# EAGLE schematic BenchTop_PHMETER_V_1.1.2 (EAGLE 9.6.2)
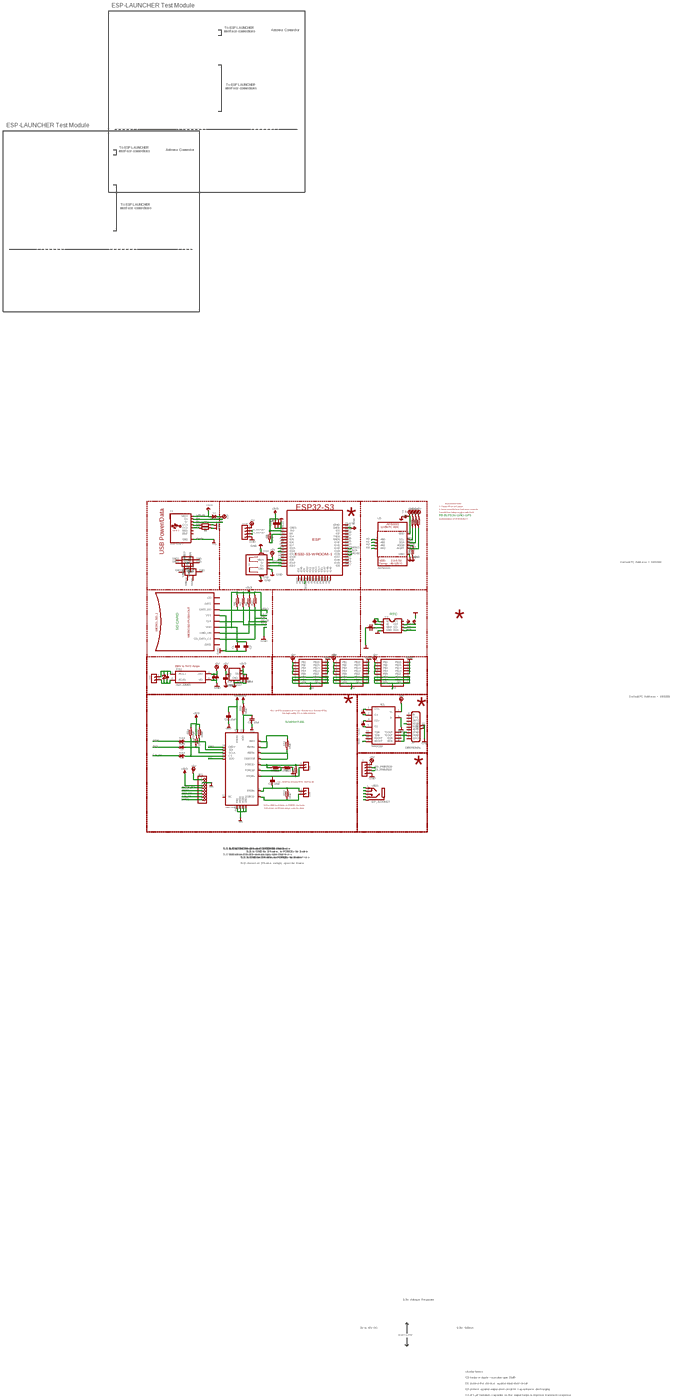
[diagram p0: schematic, sheet 1, overview]
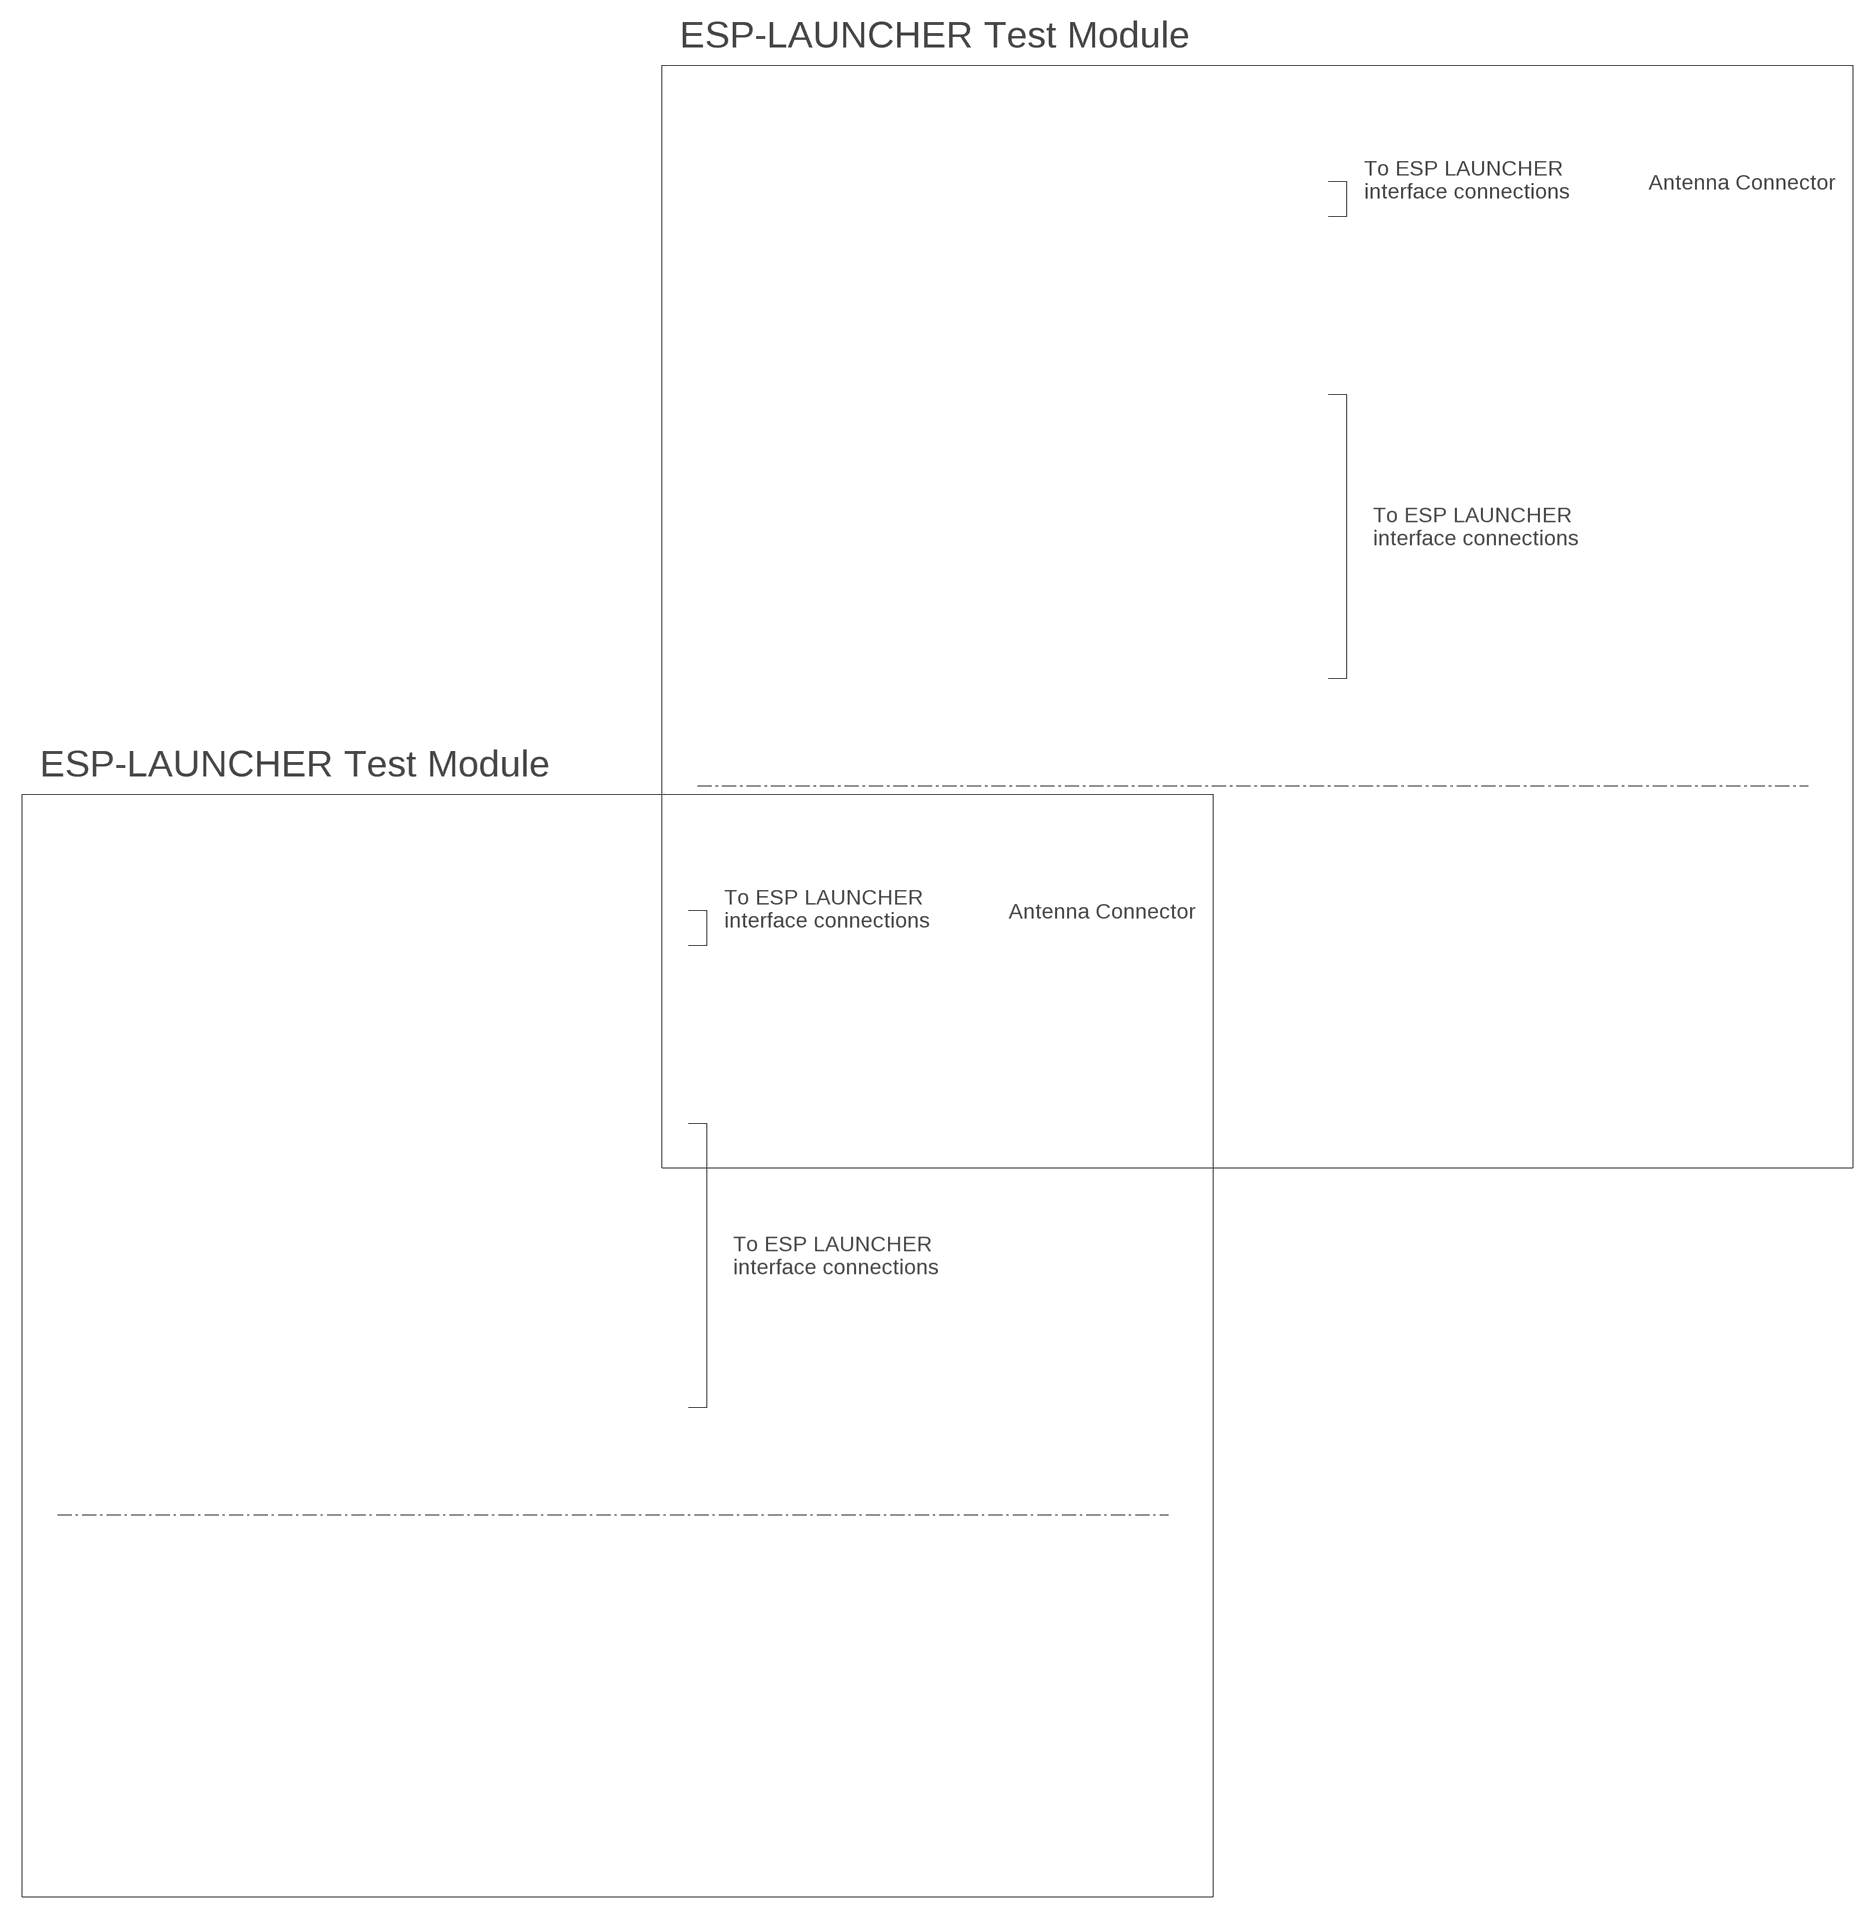
[diagram p1: schematic, sheet 1, part 1 of 4]
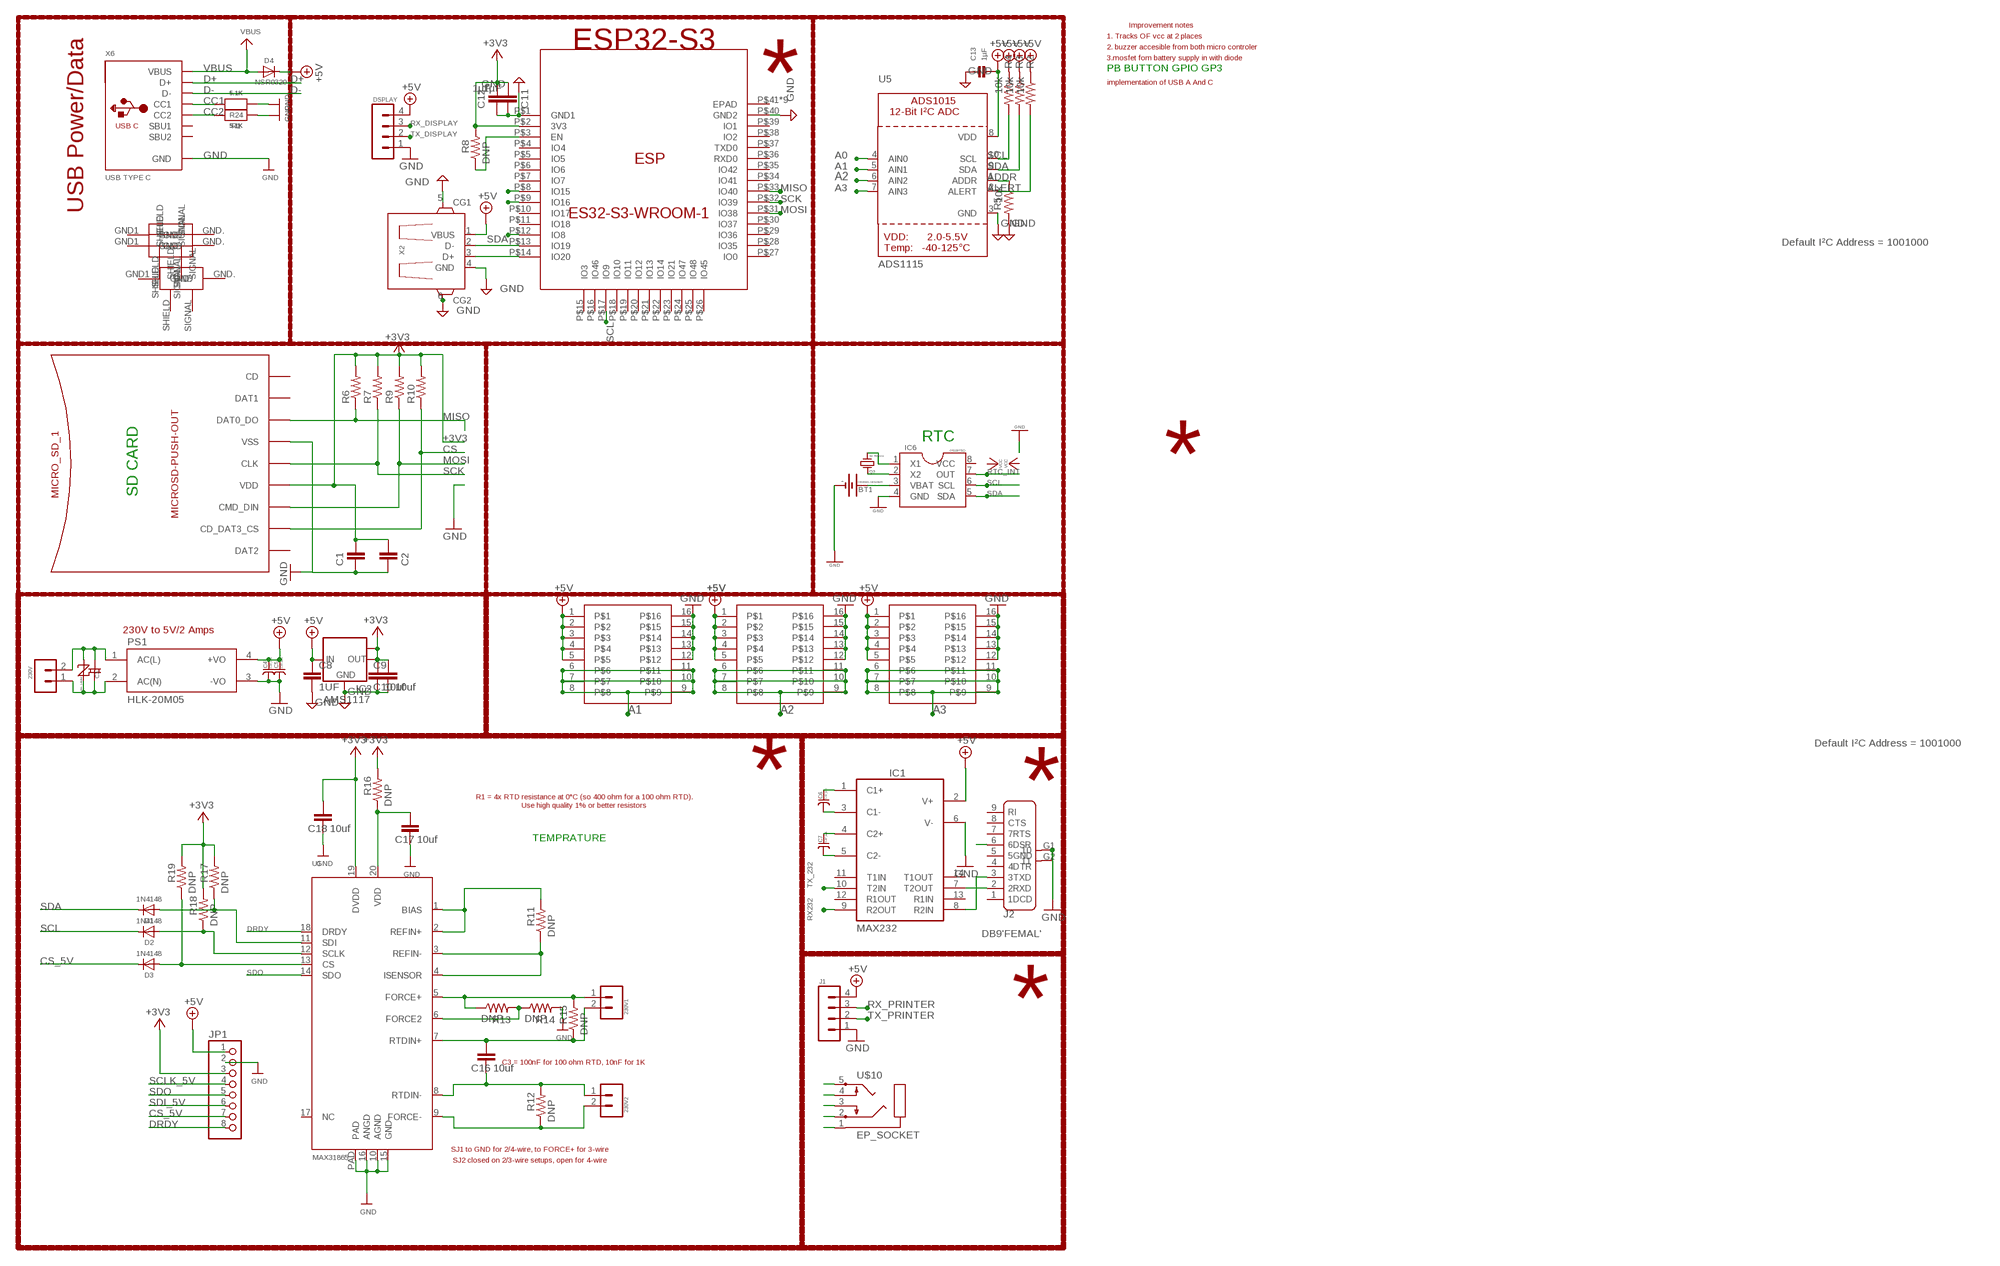
[diagram p2: schematic, sheet 1, part 2 of 4]
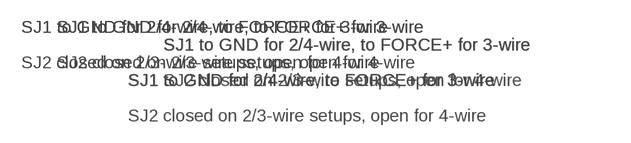
[diagram p3: schematic, sheet 1, part 3 of 4]
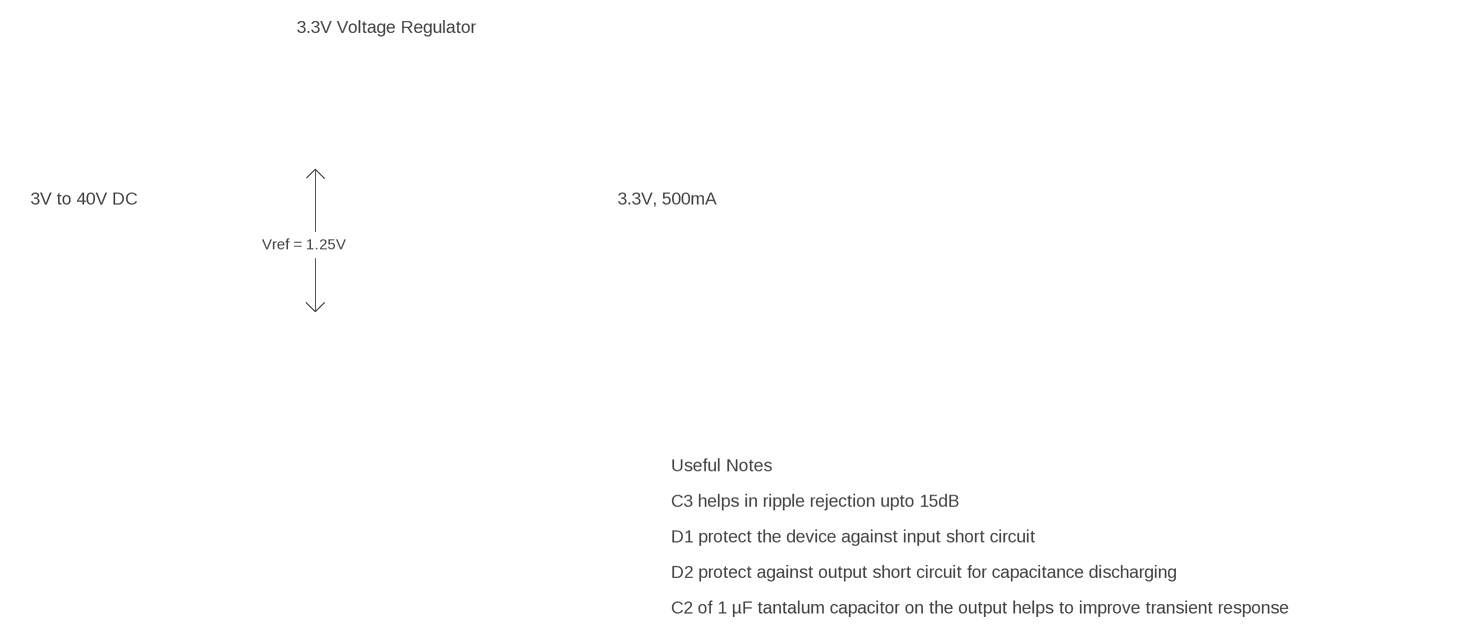
[diagram p4: schematic, sheet 1, part 4 of 4]

## Parts
230V  JST_2-PIN_1.27MMXY-126  [2-PIN_PBT_5.0MM_XY126]
230V1  JST_2-PIN_1.27MMXY-126  [2-PIN_PBT_5.0MM_XY126]
230V2  JST_2-PIN_1.27MMXY-126  [2-PIN_PBT_5.0MM_XY126]
BT1  CR2032+ HOLDER  CELL  [CELL_2032]
C1  C-EUC1206  [C1206]
C2  C-EUC1206  [C1206]
C3  CAP_X2-R  [LD22]
C4  CAP_ELE  [C_8MM]
C5  CAP_ELE  [C_8MM]
C6  CAP_ELE  [C_8MM]
C7  CAP_ELE  [C_8MM]
C8  1UF  C-EUC1206K  [C1206K]
C9  10uf  C-EUC1206K  [C1206K]
C10  10uf  C-EUC1206K  [C1206K]
C11  1µF  C-EUC0805K  [C0805K]
C12  1µF  C-EUC0805K  [C0805K]
C13  1µF  CAP_CERAMIC0805  [0805]
C16  10uf  C-EUC1206K  [C1206K]
C17  10uf  C-EUC1206K  [C1206K]
C18  10uf  C-EUC1206K  [C1206K]
D1  1N4148  DIODESOD-323  [SOD-323]
D2  1N4148  DIODESOD-323  [SOD-323]
D3  1N4148  DIODESOD-323  [SOD-323]
D4  NSR0320  DIODE_SOD323MINI  [SOD-323_MINI]
DSPLAY  JST_4-PINM  [MOLEX_4-PIN]
ESP  ES32-S3-WROOM-1  [ESP32-S3-WROOM-1]
IC1  MAX232  [DIL16]
IC2  AMS1117  LM1117MPX-5.0  [SOT223]
IC6  DS1307SO  [SOIC-08]
J1  JST_4-PINM  [MOLEX_4-PIN]
J2  DB9'FEMAL'  [DB9]
JP1  HEADER-1X870MIL  [1X08_ROUND_70]
MICRO_SD_1  MICROSD-PUSH-OUT  [MICROSD-PUSH-OUT]
PS1  HLK-20M05  [CONV_HLK-20M05]
Q3  32.768KHz  CRYSTALTC26H  [TC26H]
R1  5.1K  RESISTOR_0402NO  [_0402NO]
R2  10k  R-US_R0603  [R0603]
R3  10k  R-US_R0603  [R0603]
R4  10k  R-US_R0603  [R0603]
R5  10k  R-US_R0603  [R0603]
R6  R-US_M1206  [M1206]
R7  R-US_M1206  [M1206]
R8  DNP  R-US_R0603  [R0603]
R9  R-US_M1206  [M1206]
R10  R-US_M1206  [M1206]
R11  DNP  R-US_R0603  [R0603]
R12  DNP  R-US_R0603  [R0603]
R13  DNP  R-US_R0603  [R0603]
R14  DNP  R-US_R0603  [R0603]
R15  DNP  R-US_R0603  [R0603]
R16  DNP  R-US_R0603  [R0603]
R17  DNP  R-US_R0603  [R0603]
R18  DNP  R-US_R0603  [R0603]
R19  DNP  R-US_R0603  [R0603]
R24  5.1K  RESISTOR_0402NO  [_0402NO]
U1  MAX31865  TEMP_MAX31865  [QFN20_4MM_0.65MM]
U5  ADS1115  ADC_ADS1015  [MSOP10]
U$1  AMPLIFIER_BENCHTOP  [AMPLIFIER_BENCHTOP]
U$2  BNC_RIGHTANGLE  [BNC_RIGHTANGLE]
U$3  AMPLIFIER_BENCHTOP  [AMPLIFIER_BENCHTOP]
U$4  AMPLIFIER_BENCHTOP  [AMPLIFIER_BENCHTOP]
U$9  BNC_RIGHTANGLE  [BNC_RIGHTANGLE]
U$10  EP_SOCKET  [EP_SOCKET]
U$16  BNC_RIGHTANGLE  [BNC_RIGHTANGLE]
VR1  431_14MM  VARISTOR  [VAR_15MM]
X2  GHI2_USB_HOST_W/CHASSIS_GND  [GHI2_USB_HOST_HORIZONTAL_W/CHASSIS_GND]
X6  USB TYPE C  USB_C  [USB_C_CUSB31-CFM2AX-01-X]

## Nets
+3V3: C1.1 C2.1 C9.1 C10.1 C11.2 C12.2 C18.1 ESP.P$2(3V3) IC2.2(OUT) IC2.TAB(OUT1) JP1.3 MICRO_SD_1.4(VDD) R6.2 R7.2 R8.2 R9.2 R10.2 R16.2 R17.2 R18.2 R19.2 U1.19(DVDD)
+5V: C4.1(+) C5.1(+) C8.1 C13.2 D4.C DSPLAY.4 IC1.2(V+) IC2.3(IN) J1.4 JP1.1 PS1.4(+VO) R2.1 R3.1 R4.1 U5.8(VDD) U$1.1 U$1.2 U$1.3 U$1.4 U$1.5 U$3.1 U$3.2 U$3.3 U$3.4 U$3.5 U$4.1 U$4.2 U$4.3 U$4.4 U$4.5 X2.1(VBUS)
A0: U5.4(AIN0)
A1: U5.5(AIN1) U$1.6 U$1.7 U$1.8 U$1.9 U$1.10 U$1.11
A2: U5.6(AIN2) U$3.6 U$3.7 U$3.8 U$3.9 U$3.10 U$3.11
A3: U5.7(AIN3) U$4.6 U$4.7 U$4.8 U$4.9 U$4.10 U$4.11
ADDR: R5.1 U5.1(ADDR)
ALERT: R2.2 U5.2(ALERT)
CC1: R24.2 X6.A5(CC1)
CC2: R1.2 X6.B5(CC2)
CS: MICRO_SD_1.2(CD_DAT3_CS) R10.1
CS_5V: D3.C JP1.7
D+: X6.A6(D+) X6.B6(D+)
D-: X6.A7(D-) X6.B7(D-)
DRDY: JP1.8 U1.18(DRDY)
FORCE+: 230V1.1 R13.1 R15.2 U1.5(FORCE+)
FORCE-: 230V2.2 R12.1 U1.9(FORCE-)
GND: BT1.- C1.2 C2.2 C4.2(-) C5.2(-) C8.2 C9.2 C10.2 C11.1 C12.1 C13.1 C17.2 C18.2 DSPLAY.1 ESP.P$1(GND1) ESP.P$40(GND2) IC1.6(V-) IC2.1(GND) IC6.4(GND) J1.1 J2.G1 J2.G2 JP1.2 MICRO_SD_1.6(VSS) MICRO_SD_1.G1(VSS) MICRO_SD_1.G2(VSS) MICRO_SD_1.G3(VSS) MICRO_SD_1.G4(VSS) PS1.3(-VO) R1.1 R5.2 R14.2 R24.1 U1.10(AGND) U1.15(GND) U1.16(ANGD) U1.PAD U5.3(GND) U$1.12 U$1.13 U$1.14 U$1.15 U$1.16 U$3.12 U$3.13 U$3.14 U$3.15 U$3.16 U$4.12 U$4.13 U$4.14 U$4.15 U$4.16 X2.4(GND) X2.5(CG1) X2.6(CG2) X6.A1B12(GND) X6.B1A12(GND)
LIVE: 230V.2 C3.1 PS1.1(AC(L)) VR1.2
MISO: ESP.P$33(IO40) MICRO_SD_1.7(DAT0_DO) R6.1
MOSI: ESP.P$31(IO38) MICRO_SD_1.3(CMD_DIN) R9.1
N$2: BT1.+ IC6.3(VBAT)
N$3: IC6.1(X1) Q3.1
N$4: C6.1(+) IC1.1(C1+)
N$5: C6.2(-) IC1.3(C1-)
N$7: C7.1(+) IC1.4(C2+)
N$8: C7.2(-) IC1.5(C2-)
N$9: IC1.7(T2OUT) J2.2(2RXD)
N$10: IC6.2(X2) Q3.2
N$13: IC1.8(R2IN) J2.3(3TXD)
N$14: 230V.1 C3.2 PS1.2(AC(N)) VR1.1
N$15: ESP.P$3(EN) R8.1
N$16: ESP.P$13(IO19) X2.2(D-)
N$17: ESP.P$14(IO20) X2.3(D+)
N$18: R11.2 U1.1(BIAS) U1.2(REFIN+)
N$19: R11.1 U1.3(REFIN-) U1.4(ISENSOR)
N$20: R13.2 R14.1 U1.6(FORCE2)
N$21: D3.A R19.1 U1.13(CS)
N$22: D2.A R18.1 U1.12(SCLK)
N$23: J2.6(6DSR)
N$24: C17.1 R16.1 U1.20(VDD)
N$25: ESP.P$8(IO15)
N$26: ESP.P$9(IO16)
N$27: D1.A R17.1 U1.11(SDI)
N$32: U$10.5
N$33: U$10.4
N$34: U$10.3
N$35: U$10.2
N$36: U$10.1
RTC_INT: IC6.7(OUT)
RTDIN+: 230V1.2 C16.1 R15.1 U1.7(RTDIN+)
RTDIN-: 230V2.1 C16.2 R12.2 U1.8(RTDIN-)
RX232: IC1.9(R2OUT)
RX_DISPLAY: DSPLAY.3
RX_PRINTER: J1.3
SCK: ESP.P$32(IO39) MICRO_SD_1.5(CLK) R7.1
SCL: D2.C ESP.P$17(IO9) IC6.6(SCL) R4.2 U5.10(SCL)
SCLK_5V: JP1.4
SDA: D1.C ESP.P$12(IO8) IC6.5(SDA) R3.2 U5.9(SDA)
SDI_5V: JP1.6
SDO: JP1.5 U1.14(SDO)
TX_232: IC1.10(T2IN)
TX_DISPLAY: DSPLAY.2
TX_PRINTER: J1.2
VBUS [power]: D4.A X6.A4B9(VBUS) X6.B4A9(VBUS)
Unconnected: ESP.P$4(IO4) ESP.P$5(IO5) ESP.P$6(IO6) ESP.P$7(IO7) ESP.P$10(IO17) ESP.P$11(IO18) ESP.P$15(IO3) ESP.P$16(IO46) ESP.P$18(IO10) ESP.P$19(IO11) ESP.P$20(IO12) ESP.P$21(IO13) ESP.P$22(IO14) ESP.P$23(IO21) ESP.P$24(IO47) ESP.P$25(IO48) ESP.P$26(IO45) ESP.P$27(IO0) ESP.P$28(IO35) ESP.P$29(IO36) ESP.P$30(IO37) ESP.P$34(IO41) ESP.P$35(IO42) ESP.P$36(RXD0) ESP.P$37(TXD0) ESP.P$38(IO2) ESP.P$39(IO1) ESP.P$41(EPAD) ESP.P$42(EPAD) ESP.P$43(EPAD) ESP.P$44(EPAD) ESP.P$45(EPAD) ESP.P$46(EPAD) ESP.P$47(EPAD) ESP.P$48(EPAD) ESP.P$49(EPAD) IC1.11(T1IN) IC1.12(R1OUT) IC1.13(R1IN) IC1.14(T1OUT) IC6.8(VCC) J2.1(1DCD) J2.4(4DTR) J2.5(5GND) J2.7(7RTS) J2.8(CTS) J2.9(RI) MICRO_SD_1.1(DAT2) MICRO_SD_1.8(DAT1) MICRO_SD_1.CD U1.17(NC) U$2.GND1(GND.) U$2.GND.(GND) U$2.SHIELD U$2.SIGNAL U$9.GND1(GND.) U$9.GND.(GND) U$9.SHIELD U$9.SIGNAL U$16.GND1(GND.) U$16.GND.(GND) U$16.SHIELD U$16.SIGNAL X6.A8(SBU1) X6.B8(SBU2)

## Notes on the sheet
- ESP-LAUNCHER Test Module
- Antenna Connector
- To ESP LAUNCHER
  interface connections
- To ESP LAUNCHER
  interface connections
- ESP-LAUNCHER Test Module
- Antenna Connector
- To ESP LAUNCHER
  interface connections
- To ESP LAUNCHER
  interface connections
- Improvement notes
- 1. Tracks OF vcc at 2 places
- ✅ | 2. buzzer accesible from both micro controler
- 3.mosfet fom battery supply in with diode
- * | PB BUTTON GPIO GP3
- implementation of USB A And C
- USB Power/Data
- Default I²C Address = 1001000
- ✅
- RTC
- *
- SD CARD | ✅
- ✅ | ✅
- 230V to 5V/2 Amps
- Default I²C Address = 1001000
- * | *
- R1 = 4x RTD resistance at 0°C (so 400 ohm for a 100 ohm RTD).
  Use high quality 1% or better resistors
- TEMPRATURE
- *
- C3 = 100nF for 100 ohm RTD, 10nF for 1K
- SJ1 to GND for 2/4-wire, to FORCE+ for 3-wire
- SJ2 closed on 2/3-wire setups, open for 4-wire
- SJ1 to GND for 2/4-wire, to FORCE+ for 3-wire | SJ1 to GND for 2/4-wire, to FORCE+ for 3-wire | SJ1 to GND for 2/4-wire, to FORCE+ for 3-wire | SJ1 to GND for 2/4-wire, to FORCE+ for 3-wire
- SJ1 to GND for 2/4-wire, to FORCE+ for 3-wire | SJ1 to GND for 2/4-wire, to FORCE+ for 3-wire
- SJ2 closed on 2/3-wire setups, open for 4-wire | SJ2 closed on 2/3-wire setups, open for 4-wire
- SJ1 to GND for 2/4-wire, to FORCE+ for 3-wire | SJ1 to GND for 2/4-wire, to FORCE+ for 3-wire | SJ2 closed on 2/3-wire setups, open for 4-wire
- SJ2 closed on 2/3-wire setups, open for 4-wire
- 3.3V Voltage Regulator
- 3V to 40V DC | 3.3V, 500mA
- Vref = 1.25V
- Useful Notes
- C3 helps in ripple rejection upto 15dB
- D1 protect the device against input short circuit
- D2 protect against output short circuit for capacitance discharging
- C2 of 1 µF tantalum capacitor on the output helps to improve transient response

## Power pins joined to a net without a drawn wire
GND: IC1.15(GND)
VCC: IC1.16(VCC)

## Library data of the parts
230V 230V1 230V2 = Squadron:JST_2-PIN_1.27MM
BT1 = Squadron:CELL
C1 C2 C8-C12 C16-C18 = rcl:C-EU: CAPACITOR, European symbol; SPICEPREFIX: C
C3 = Squadron:CAP_X2
C4-C7 = Squadron:CAP_ELE
C13 = microbuilder:CAP_CERAMIC: Ceramic Capacitors 0402 - 0402 Surface Mount Capacitors 16pF 50V 5% [Digikey: 445-4899-2-ND] 18pF 50V 5% [Digikey: 490-1281-2-ND] 22pF 50V 5% [Digikey: 490-1283-2-ND] 68pF 50V 5% [Digikey: 490-1289-2-ND] 0.1uF 10V 10% [Digikey: 490-1318-2-ND] 1.0uF 6.3V 10% [Digikey: 490-1320-2-ND] 0603 - 0603 Surface Mount Capacitors 16 pF 50V 5% [Digikey: 445-5051-2-ND] 22 pF 50V [Digikey: PCC220ACVTR-ND] 33 pF 50V 5% [Digikey: 490-1415-1-ND] 56pF 50V 5% [Digikey: 490-1421-1-ND] 220pF 50V 5% [Digikey: 445-1285-1-ND] 680 pF 50V 2200 pF 50V 5% C0G [Digikey: 445-1297-1-ND] 5600 pF 100V 5% X7R [Digikey: 478-3711-1-ND] 0.1 µF 25V 10% [Digikey: PCC2277TR-ND] 0.22 µF 16V 10% X7R [Digikey: 445-1318-1-ND] 1.0 µF 25V 10% [Digikey: 445-5146-2-ND] 0603 - RF Specific 3pF 250V +/-0.1pF RF [Digikey: 712-1347-1-ND] 18 pF 250V 5% [Digikey: 478-3505-1-ND or 712-1322-1-ND] 56 pF 250V 5% C0G RF [Digikey: 490-4867-1-ND] 68 pF 250V RF [Digikey: 490-4868-1-ND] 0805 - 0805 Surface Mount Capacitors 220 pF 250V 2% RF Ceramic Capacitor [Digikey: 712-1398-1-ND] 1000 pF 50V 2% NP0 Ceramic Capacitor [Digikey: 478-3760-1-ND] 0.1 µF 25V 10% Ceramic Capacitor [Digikey: PCC1828TR-ND] 1.0 µF 16V 10% Ceramic Capacitor[Digikey: 490-1691-2-ND] 10.0 µF 10V 10% Ceramic Capacitor[Digikey: 709-1228-1-ND] 10.0 uF 16V 10% Ceramic Capacitor [Digikey: 478-5165-2-ND] 47 uF 6.3V 20% Ceramic Capacitor [Digikey: 587-1779-1-ND or 399-5506-1-ND] 1206 - 1206 Surface Mount Capacitors 47uF 10V 20% Ceramic Capacitor [Digikey: 490-5528-1-ND or 399-5508-1-ND or 445-6010-1-ND] 100uF 6.3V -20%, +80% Y5V Ceramic Capacitor (Digikey: 490-4512-1-ND, Mouser: 81-GRM31CF50J107ZE1L)
D1-D4 = microbuilder:DIODE: Diode SMA Model Volts Amps Type Vf Ir Digikey # Notes SSA34-E3 40V 3A Schottky 480mV @ 3A 200uA @ 40V SSA34-E3/61TGITR-ND CDBA120-G 20V 1A Schottky 500mV @ 1A 500uA @ 20V 641-1014-6-ND REEL MBRA210 10V 2A Schottky 350mV @ 2A 700uA @ 10V MBRA210LT3 SOD-123 Model Volts Amps Type Vf Ir Order # Notes BAT54T1G 30V 200mA Schottky 800mV @ 200mA 2uA @ 25V BAT54T1GOSTR-ND B0530W 30V 500mA Schottky 430mV @ 500mA 130uA @ 30V B0530W-FDICT-ND REEL MBR120 20V 1A Schottky 340mV @ 1A MBR120VLSFT1GOSCT-ND SOD-323 Model Volts Amps Type Vf Ir Order # Notes PMEG2005EJ 20V 500mA Schottky 355mV @ 500mA 568-4110-1-ND ZLLS410 10V 570mA Schottky 380mV @ 570mA ZLLS410CT-ND 1N4148WS 75V 150mA Silicon/Simple 1V 1N4148WSFSCT-ND REEL SOD-523 Model Volts Amps Type Vf Ir Order # Notes BAT54XV2 30V 200mA Schottky 0.8V @ 100mA BAT54XV2CT-ND TB751S 30V 30mA Schottky RB751S-40TE61CT-ND SOT23-R/W (R = Solder Paste/Reflow Ovens, W = Hand-Soldering) Model Volts Amps Type Vf Ir Order # Notes BAT54FILM 40V 300mA Schottky 497-7162-1-ND POWERDI-5 Model Volts Amps Type Vf Ir Order # Notes PDS560 60V 5A Schottky 670mV @ 5A 150uA @ 60V PDS560DICT-ND
DSPLAY J1 = Squadron:JST_4-PIN
ESP = ESP32 Module:ES32-S3-WROOM-1
IC1 = maxim:MAX232: RS232 TRANSCEIVER; MF: MAXIM; MPN: MAX232ACPE+; OC_FARNELL: 9723773; OC_NEWARK: 68K4544
IC2 = lm1117:LM1117MPX-*
IC6 = Squadron:DS1307
J2 = DB9:DB9: Check availability <https://pricing.snapeda.com/parts/DB-9/Amphenol/view-part?ref=eda>; AVAILABILITY: In Stock; CHECK_PRICES: https://www.snapeda.com/parts/DB-9/Amphenol/view-part/?ref=eda; DESCRIPTION: Cable Grip 0.38 ~ 0.50 (9.5mm ~ 12.7mm) Aluminum - Silver; MF: Amphenol; MP: DB-9; PACKAGE: None; PRICE: None; SNAPEDA_LINK: https://www.snapeda.com/parts/DB-9/Amphenol/view-part/?ref=snap
JP1 = microbuilder:HEADER-1X8: PIN HEADER
MICRO_SD_1 = microsd:MICROSD-PUSH-OUT: T-Flash Push-Out Micro SD Card Reader 14.75mm x 14.5mm SMD with external pins
PS1 = HLK-20M05:HLK-20M05: Check availability <https://pricing.snapeda.com/parts/HLK-20M05/Hi-link/view-part?ref=eda>; AVAILABILITY: Not in stock; CHECK_PRICES: https://www.snapeda.com/parts/HLK-20M05/Hi-link/view-part/?ref=eda; DESCRIPTION: 20W ultra-small series module power supply; MF: Hi-link; MP: HLK-20M05; PACKAGE: Non-Standard Hi-link; PRICE: None; SNAPEDA_LINK: https://www.snapeda.com/parts/HLK-20M05/Hi-link/view-part/?ref=snap
Q3 = crystal:CRYSTAL: Crystals Various standard crystals. Proven footprints. Spark Fun Electronics SKU : COM-00534
R1 R24 = microbuilder:RESISTOR: Resistors For new designs, use the packages preceded by an '_' character since they are more reliable: The following footprints should be used on most boards: _0402 - Standard footprint for regular board layouts _0603 - Standard footprint for regular board layouts _0805 - Standard footprint for regular board layouts _1206 - Standard footprint for regular board layouts For extremely tight-pitch boards where space is at a premium, the following 'micro-pitch' footprints can be used (smaller pads, no silkscreen outline, etc.): _0402MP - Micro-pitch footprint for very dense/compact boards _0603MP - Micro-pitch footprint for very dense/compact boards _0805MP - Micro-pitch footprint for very dense/compact boards _1206MP - Micro-pitch footprint for very dense/compact boards
R2-R19 = rcl:R-US_: RESISTOR, American symbol; SPICEPREFIX: R
U1 = microbuilder:TEMP_MAX31865: MAX31865 - Resistance to Digital Convertor for Platinum Resistance Temperature Detectors (RTDs) Handles 100 ohm - 1K ohm (at 0°C) platinum RTDs. 15-bit ADC resolution (nominally 0.03125°C), 0.5°C accuracy.
U5 = microbuilder:ADC_ADS1015: ADS1015 - 12-bit 4-Channel I2C ADC with Internal PGA VDD: 2.0-5.5V Sampling Rate: 3.3ksps Gain Settings: 2/3, 1, 2, 4, 8, 16 I2C Address: ADDR low = 1001000x, ADDR high = 1001001x Internal Comparator The ADS1015 includes an internal comparator that can be set to output a high-level on ALERT when the conversion results exceeeds a pre-defined upper level, and will deassert itself when the level falls below a pre-defined lower threshold level. It can also be set to windowed mode where the ALERT pin will be asserted if the data exceeds the upper threshold or falls below the lower threshold.
U$1 U$3 U$4 = Squadron:AMPLIFIER_BENCHTOP
U$2 U$9 U$16 = Squadron:BNC_RIGHTANGLE
U$10 = Squadron:EP_SOCKET
VR1 = Squadron:VARISTOR
X2 = BeagleBone_Black_Wireless:GHI2_USB_HOST_W/CHASSIS_GND
X6 = adafruit_electromech:USB_C: USB Type-C USB 2.0 Connector

## Module WAVESHAREDISPLAY
Ports: 

### Library data of the parts

## Net classes
1 power: width 0.254 mm